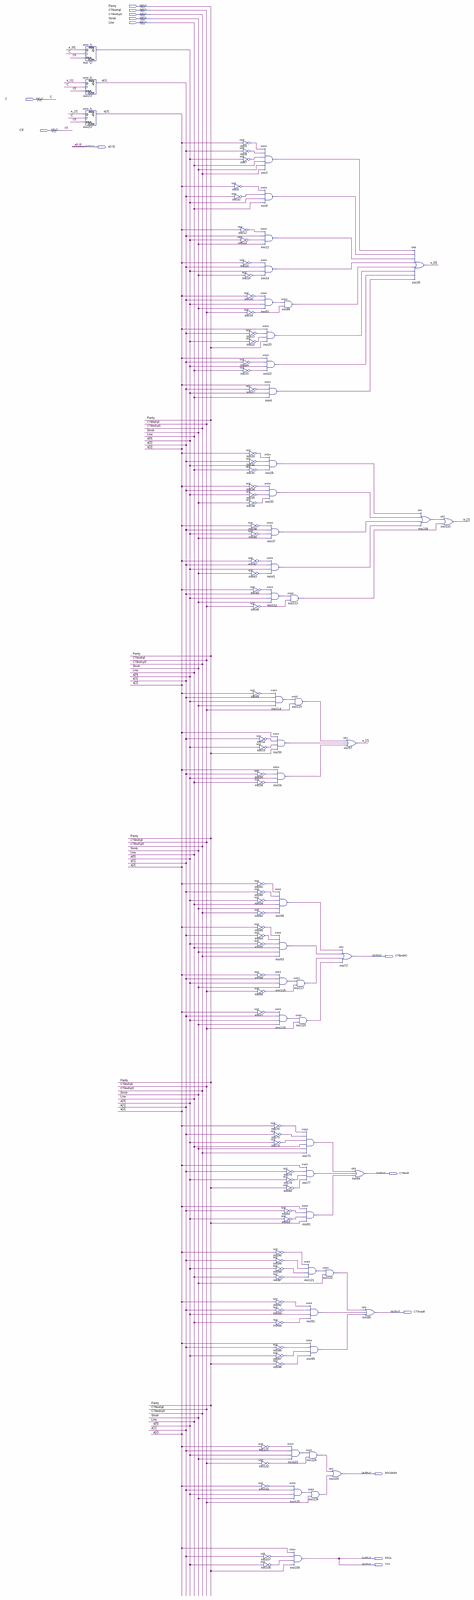
[diagram p0: schematic sheet, whole]
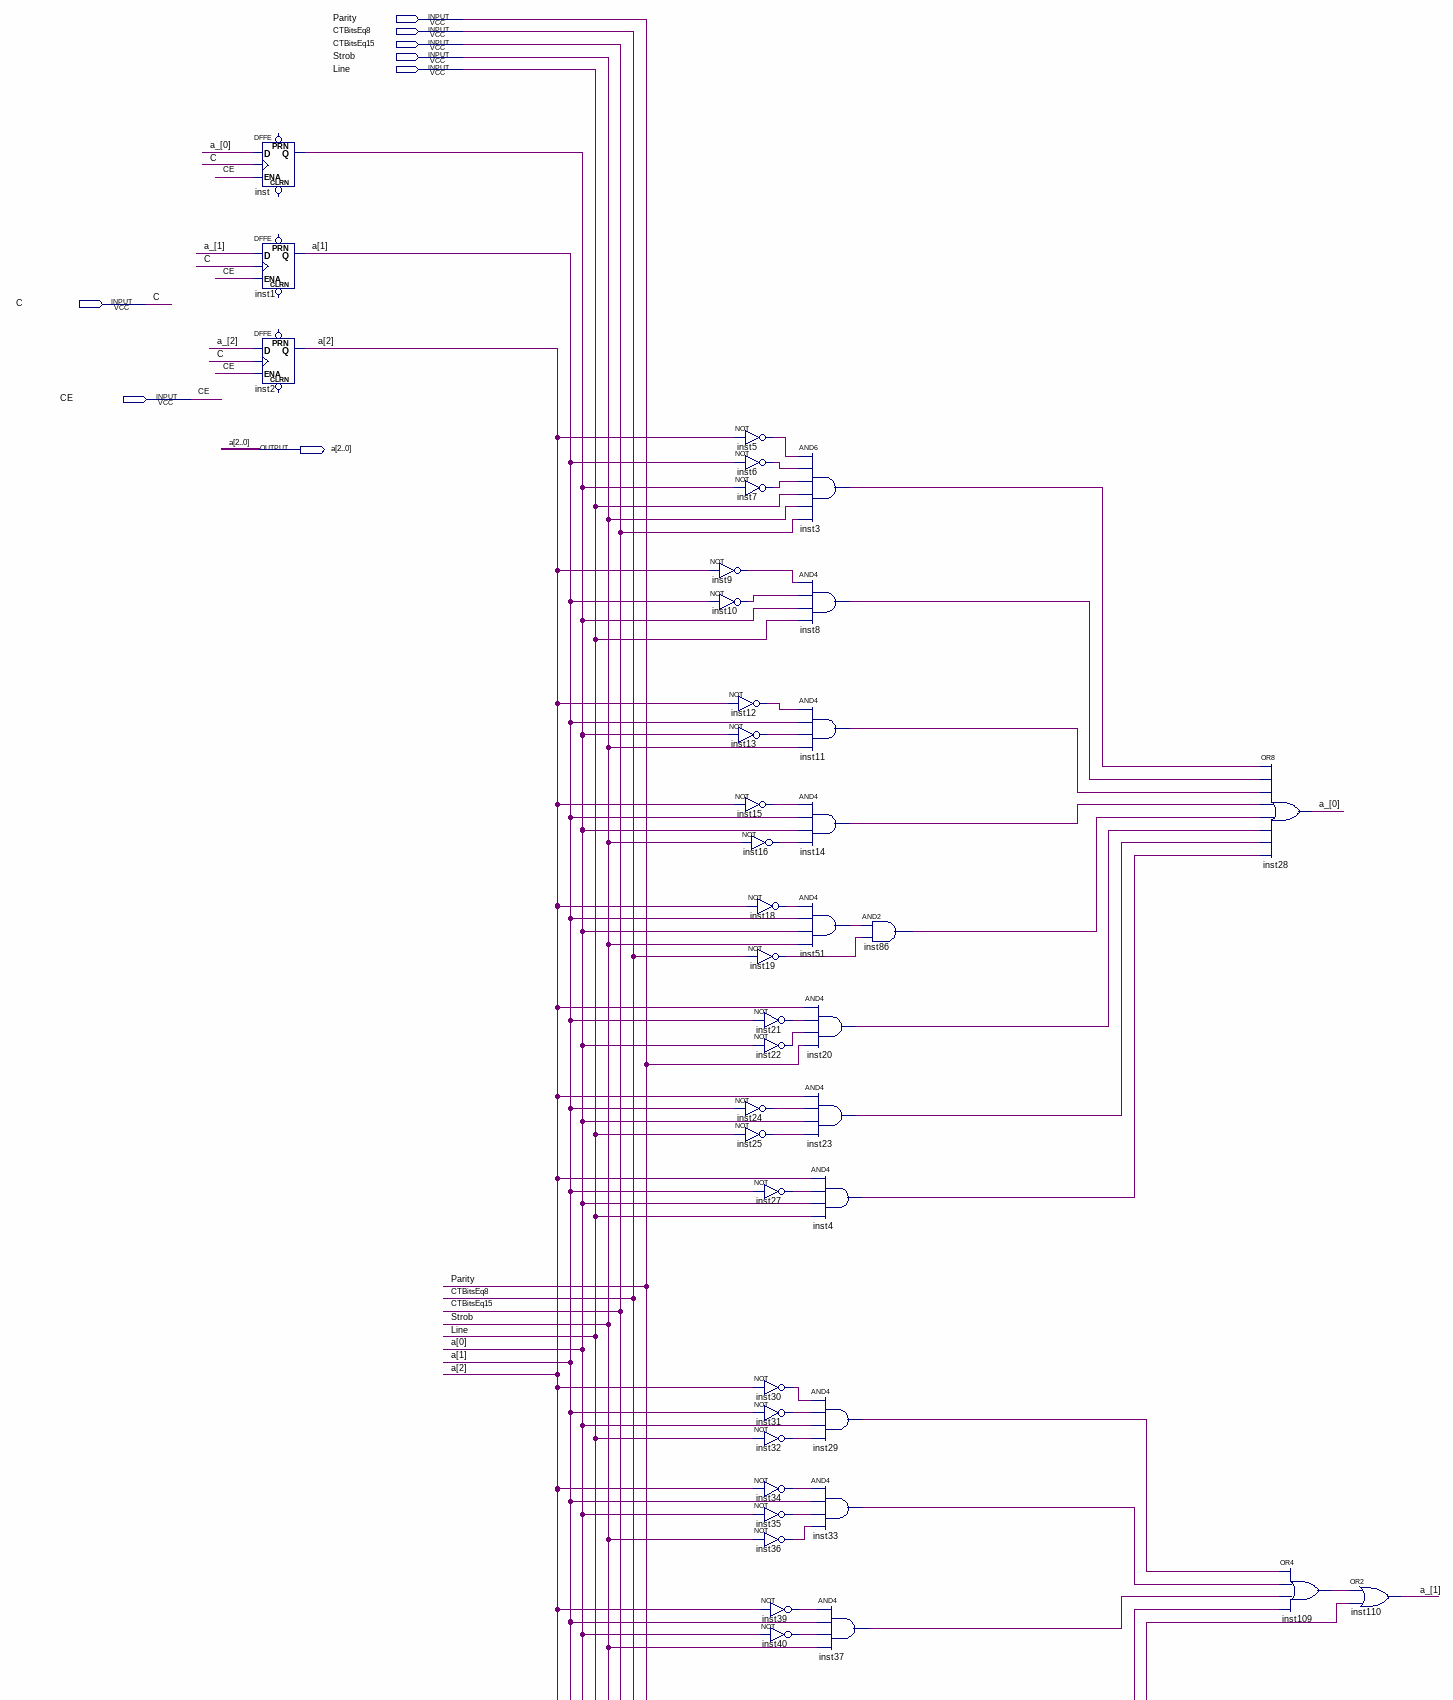
[diagram p1: schematic sheet, upper part]
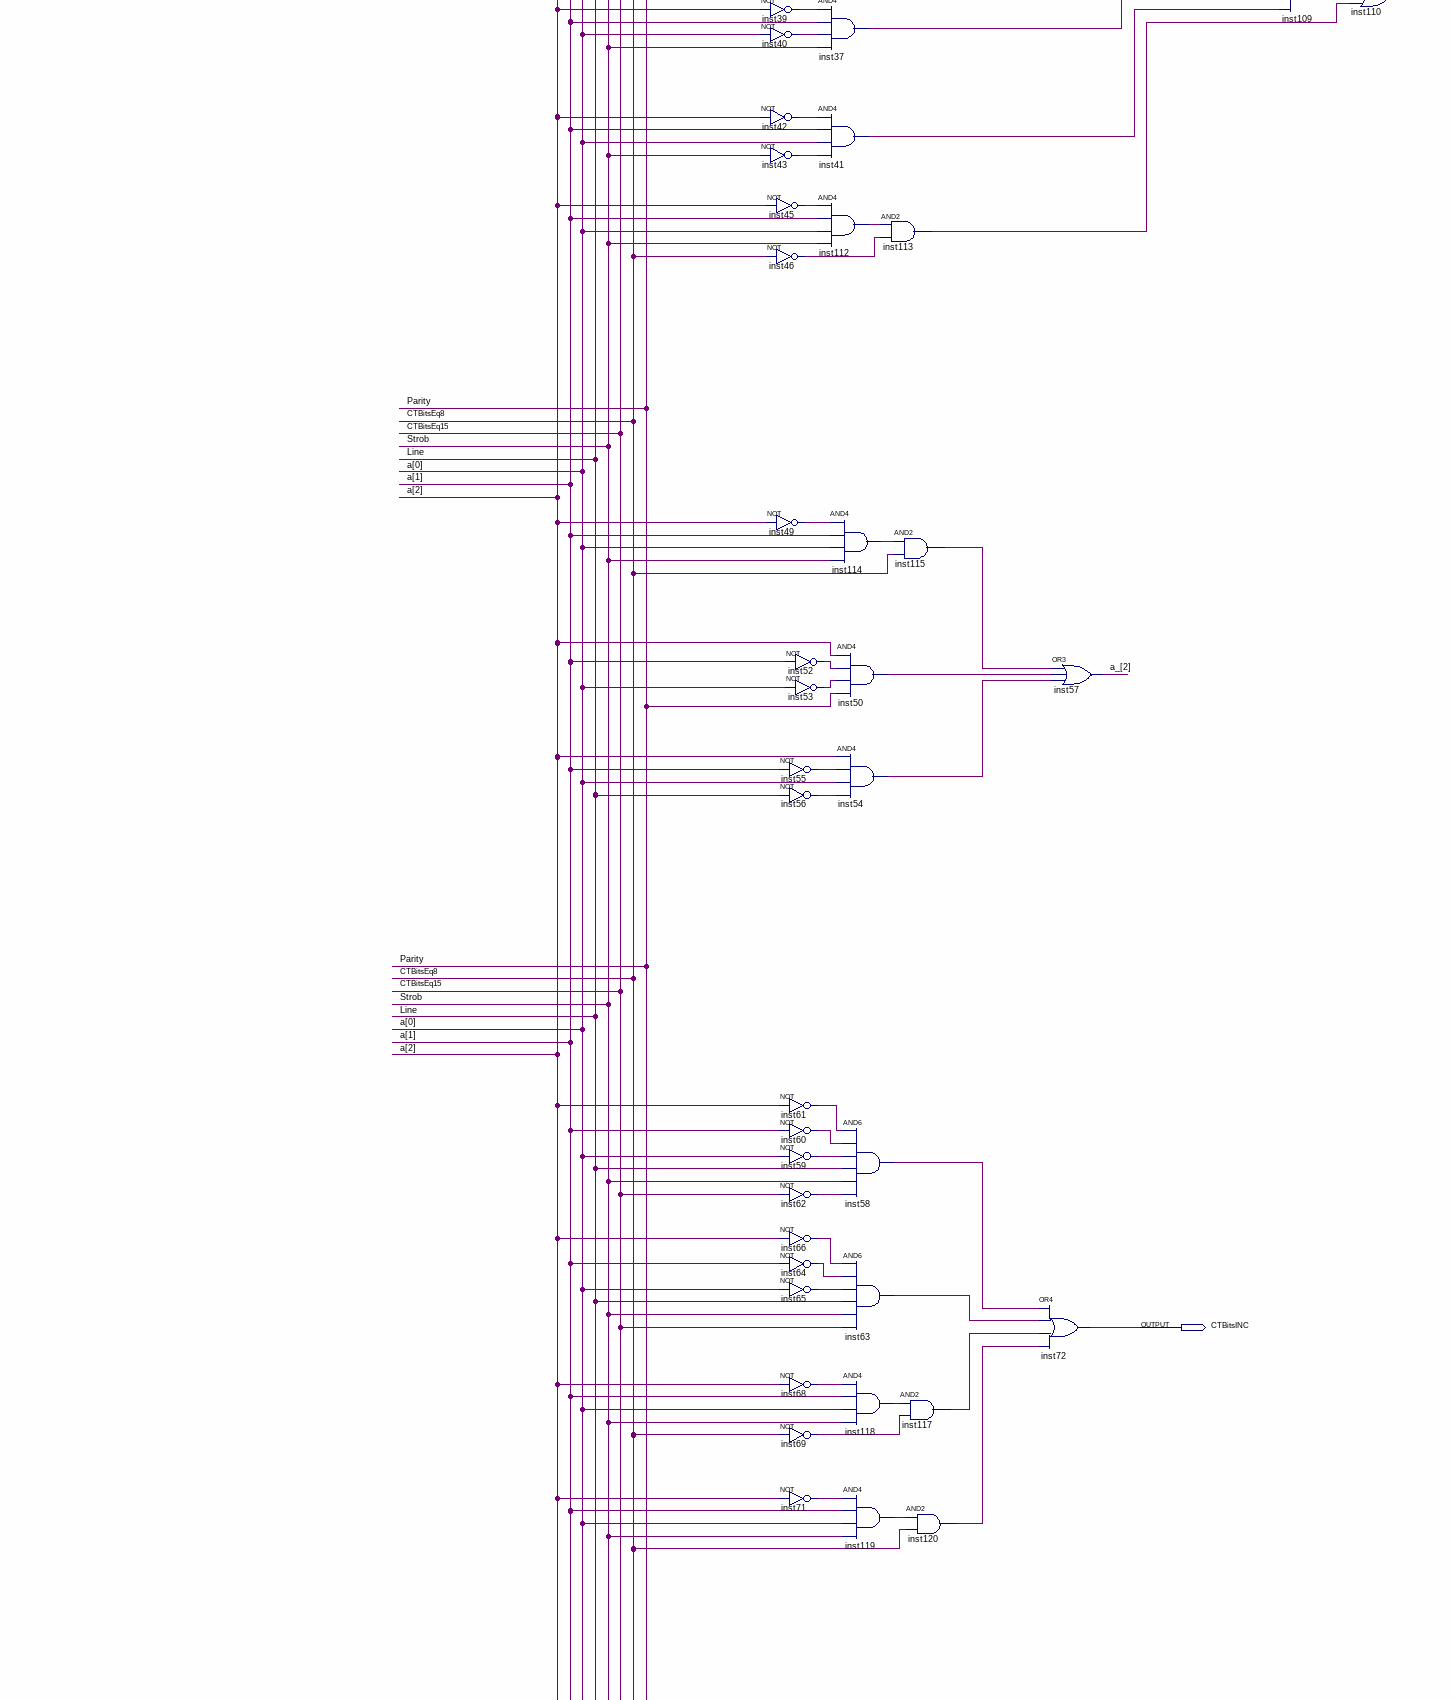
[diagram p2: schematic sheet, middle part]
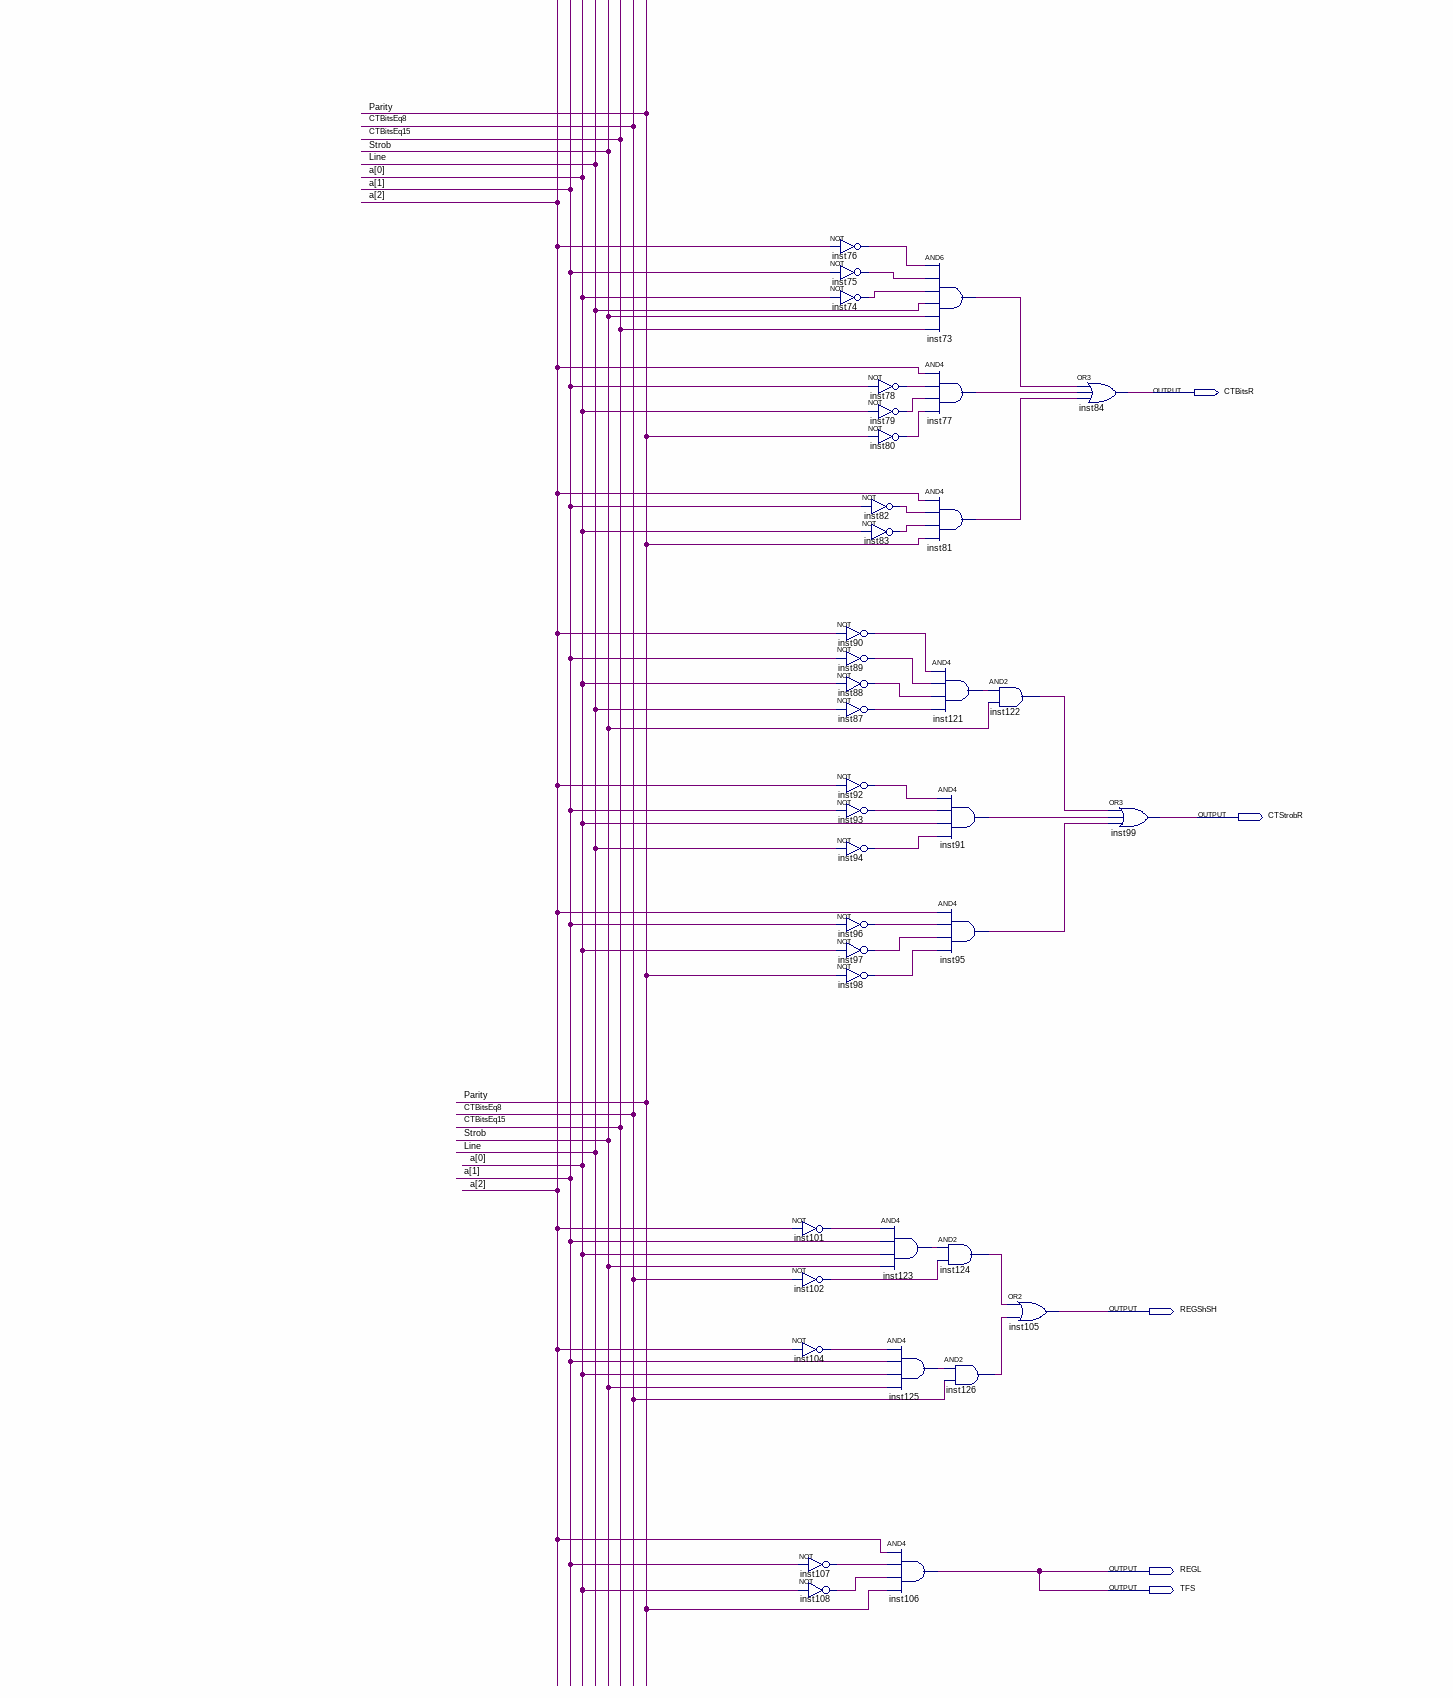
[diagram p3: schematic sheet, lower part]
// Quartus schematic ReceivCD.bdf as structural Verilog: 114 symbols, 14 pins
module ReceivCD (
  input  Parity,
  input  CTBitsEq8,
  input  CTBitsEq15,
  input  Strob,
  input  Line,
  input  C,
  input  CE,
  output [2:0] a,
  output CTBitsINC,
  output CTBitsR,
  output CTStrobR,
  output REGShSH,
  output REGL,
  output TFS
);

  wire inst3_out, inst4_out, inst5_out, inst6_out, inst7_out, inst8_out, inst9_out, inst10_out, inst11_out,
       inst12_out, inst13_out, inst14_out, inst15_out, inst16_out, inst18_out, inst19_out, inst20_out,
       inst21_out, inst22_out, inst23_out, inst24_out, inst25_out, inst27_out, inst29_out, inst30_out,
       inst31_out, inst32_out, inst33_out, inst34_out, inst35_out, inst36_out, inst37_out, inst39_out,
       inst40_out, inst41_out, inst42_out, inst43_out, inst45_out, inst46_out, inst49_out, inst50_out,
       inst51_out, inst52_out, inst53_out, inst54_out, inst55_out, inst56_out, inst58_out, inst59_out,
       inst60_out, inst61_out, inst62_out, inst63_out, inst64_out, inst65_out, inst66_out, inst68_out,
       inst69_out, inst71_out, inst73_out, inst74_out, inst75_out, inst76_out, inst77_out, inst78_out,
       inst79_out, inst80_out, inst81_out, inst82_out, inst83_out, inst86_out, inst87_out, inst88_out,
       inst89_out, inst90_out, inst91_out, inst92_out, inst93_out, inst94_out, inst95_out, inst96_out,
       inst97_out, inst98_out, inst101_out, inst102_out, inst104_out, inst107_out, inst108_out, inst109_out,
       inst112_out, inst113_out, inst114_out, inst115_out, inst117_out, inst118_out, inst119_out,
       inst120_out, inst121_out, inst122_out, inst123_out, inst124_out, inst125_out, inst126_out;
  wire [2:0] a_;

  DFFE inst (.D(a_[0]), .CLK(C), .ENA(CE), .Q(a[0]));  // open: PRN, CLRN
  DFFE inst1 (.D(a_[1]), .CLK(C), .ENA(CE), .Q(a[1]));  // open: PRN, CLRN
  DFFE inst2 (.D(a_[2]), .CLK(C), .ENA(CE), .Q(a[2]));  // open: PRN, CLRN
  not inst5 (inst5_out, a[2]);
  not inst6 (inst6_out, a[1]);
  not inst7 (inst7_out, a[0]);
  not inst9 (inst9_out, a[2]);
  not inst10 (inst10_out, a[1]);
  not inst12 (inst12_out, a[2]);
  not inst13 (inst13_out, a[0]);
  not inst15 (inst15_out, a[2]);
  not inst24 (inst24_out, a[1]);
  not inst25 (inst25_out, Line);
  not inst16 (inst16_out, Strob);
  not inst18 (inst18_out, a[2]);
  not inst19 (inst19_out, CTBitsEq8);
  not inst21 (inst21_out, a[1]);
  not inst22 (inst22_out, a[0]);
  not inst27 (inst27_out, a[1]);
  not inst30 (inst30_out, a[2]);
  not inst31 (inst31_out, a[1]);
  not inst32 (inst32_out, Line);
  not inst34 (inst34_out, a[2]);
  not inst35 (inst35_out, a[0]);
  not inst36 (inst36_out, Strob);
  not inst39 (inst39_out, a[2]);
  not inst40 (inst40_out, a[0]);
  not inst42 (inst42_out, a[2]);
  not inst43 (inst43_out, Strob);
  not inst45 (inst45_out, a[2]);
  not inst46 (inst46_out, CTBitsEq8);
  not inst49 (inst49_out, a[2]);
  not inst52 (inst52_out, a[1]);
  not inst53 (inst53_out, a[0]);
  not inst55 (inst55_out, a[1]);
  not inst56 (inst56_out, Line);
  not inst61 (inst61_out, a[2]);
  not inst60 (inst60_out, a[1]);
  not inst59 (inst59_out, a[0]);
  not inst62 (inst62_out, CTBitsEq15);
  not inst66 (inst66_out, a[2]);
  not inst64 (inst64_out, a[1]);
  not inst65 (inst65_out, a[0]);
  not inst68 (inst68_out, a[2]);
  not inst69 (inst69_out, CTBitsEq8);
  not inst71 (inst71_out, a[2]);
  and inst3 (inst3_out, inst5_out, inst6_out, inst7_out, Line, Strob, CTBitsEq15);
  and inst8 (inst8_out, inst9_out, inst10_out, a[0], Line);
  and inst11 (inst11_out, inst12_out, a[1], inst13_out, Strob);
  and inst14 (inst14_out, inst15_out, a[1], a[0], inst16_out);
  and inst51 (inst51_out, inst18_out, a[1], a[0], Strob);
  and inst20 (inst20_out, a[2], inst21_out, inst22_out, Parity);
  and inst23 (inst23_out, a[2], inst24_out, a[0], inst25_out);
  and inst4 (inst4_out, a[2], inst27_out, a[0], Line);
  and inst29 (inst29_out, inst30_out, inst31_out, a[0], inst32_out);
  and inst33 (inst33_out, inst34_out, a[1], inst35_out, inst36_out);
  and inst37 (inst37_out, inst39_out, a[1], inst40_out, Strob);
  and inst41 (inst41_out, inst42_out, a[1], a[0], inst43_out);
  and inst112 (inst112_out, inst45_out, a[1], a[0], Strob);
  and inst114 (inst114_out, inst49_out, a[1], a[0], Strob);
  and inst50 (inst50_out, a[2], inst52_out, inst53_out, Parity);
  and inst54 (inst54_out, a[2], inst55_out, a[0], inst56_out);
  not inst76 (inst76_out, a[2]);
  not inst75 (inst75_out, a[1]);
  not inst74 (inst74_out, a[0]);
  not inst90 (inst90_out, a[2]);
  not inst89 (inst89_out, a[1]);
  not inst88 (inst88_out, a[0]);
  not inst87 (inst87_out, Line);
  not inst92 (inst92_out, a[2]);
  not inst93 (inst93_out, a[1]);
  not inst94 (inst94_out, Line);
  not inst96 (inst96_out, a[1]);
  not inst97 (inst97_out, a[0]);
  not inst98 (inst98_out, Parity);
  not inst101 (inst101_out, a[2]);
  not inst102 (inst102_out, CTBitsEq8);
  not inst104 (inst104_out, a[2]);
  not inst107 (inst107_out, a[1]);
  not inst108 (inst108_out, a[0]);
  and inst86 (inst86_out, inst51_out, inst19_out);
  and inst113 (inst113_out, inst112_out, inst46_out);
  and inst58 (inst58_out, inst61_out, inst60_out, inst59_out, Line, Strob, inst62_out);
  and inst63 (inst63_out, inst66_out, inst64_out, inst65_out, Line, Strob, CTBitsEq15);
  and inst118 (inst118_out, inst68_out, a[1], a[0], Strob);
  and inst119 (inst119_out, inst71_out, a[1], a[0], Strob);
  not inst78 (inst78_out, a[1]);
  not inst79 (inst79_out, a[0]);
  not inst80 (inst80_out, Parity);
  not inst82 (inst82_out, a[1]);
  not inst83 (inst83_out, a[0]);
  and inst123 (inst123_out, inst101_out, a[1], a[0], Strob);
  and inst125 (inst125_out, inst104_out, a[1], a[0], Strob);
  and inst106 (REGL, a[2], inst107_out, inst108_out, Parity);
  and inst115 (inst115_out, inst114_out, CTBitsEq8);
  and inst117 (inst117_out, inst118_out, inst69_out);
  and inst120 (inst120_out, inst119_out, CTBitsEq8);
  and inst73 (inst73_out, inst76_out, inst75_out, inst74_out, Line, Strob, CTBitsEq15);
  and inst77 (inst77_out, a[2], inst78_out, inst79_out, inst80_out);
  and inst81 (inst81_out, a[2], inst82_out, inst83_out, Parity);
  and inst121 (inst121_out, inst90_out, inst89_out, inst88_out, inst87_out);
  and inst91 (inst91_out, inst92_out, inst93_out, a[0], inst94_out);
  and inst95 (inst95_out, a[2], inst96_out, inst97_out, inst98_out);
  and inst124 (inst124_out, inst123_out, inst102_out);
  and inst122 (inst122_out, inst121_out, Strob);
  and inst126 (inst126_out, inst125_out, CTBitsEq8);
  or inst72 (CTBitsINC, inst58_out, inst63_out, inst117_out, inst120_out);
  or inst105 (REGShSH, inst124_out, inst126_out);
  or inst57 (a_[2], inst115_out, inst50_out, inst54_out);
  or inst84 (CTBitsR, inst73_out, inst77_out, inst81_out);
  or inst99 (CTStrobR, inst122_out, inst91_out, inst95_out);
  or inst28 (a_[0], inst3_out, inst8_out, inst11_out, inst14_out, inst86_out, inst20_out, inst23_out, inst4_out);
  or inst109 (inst109_out, inst29_out, inst33_out, inst37_out, inst41_out);
  or inst110 (a_[1], inst109_out, inst113_out);

  assign TFS = REGL;
endmodule
